# Altium schematic sheet [05] - PERIFERALS DIAGRAM.SchDoc
size A3; DocumentNumber: 2; SheetNumber: 2; SheetTotal: 4; .Checked PCB: .; .Checked SCH: .
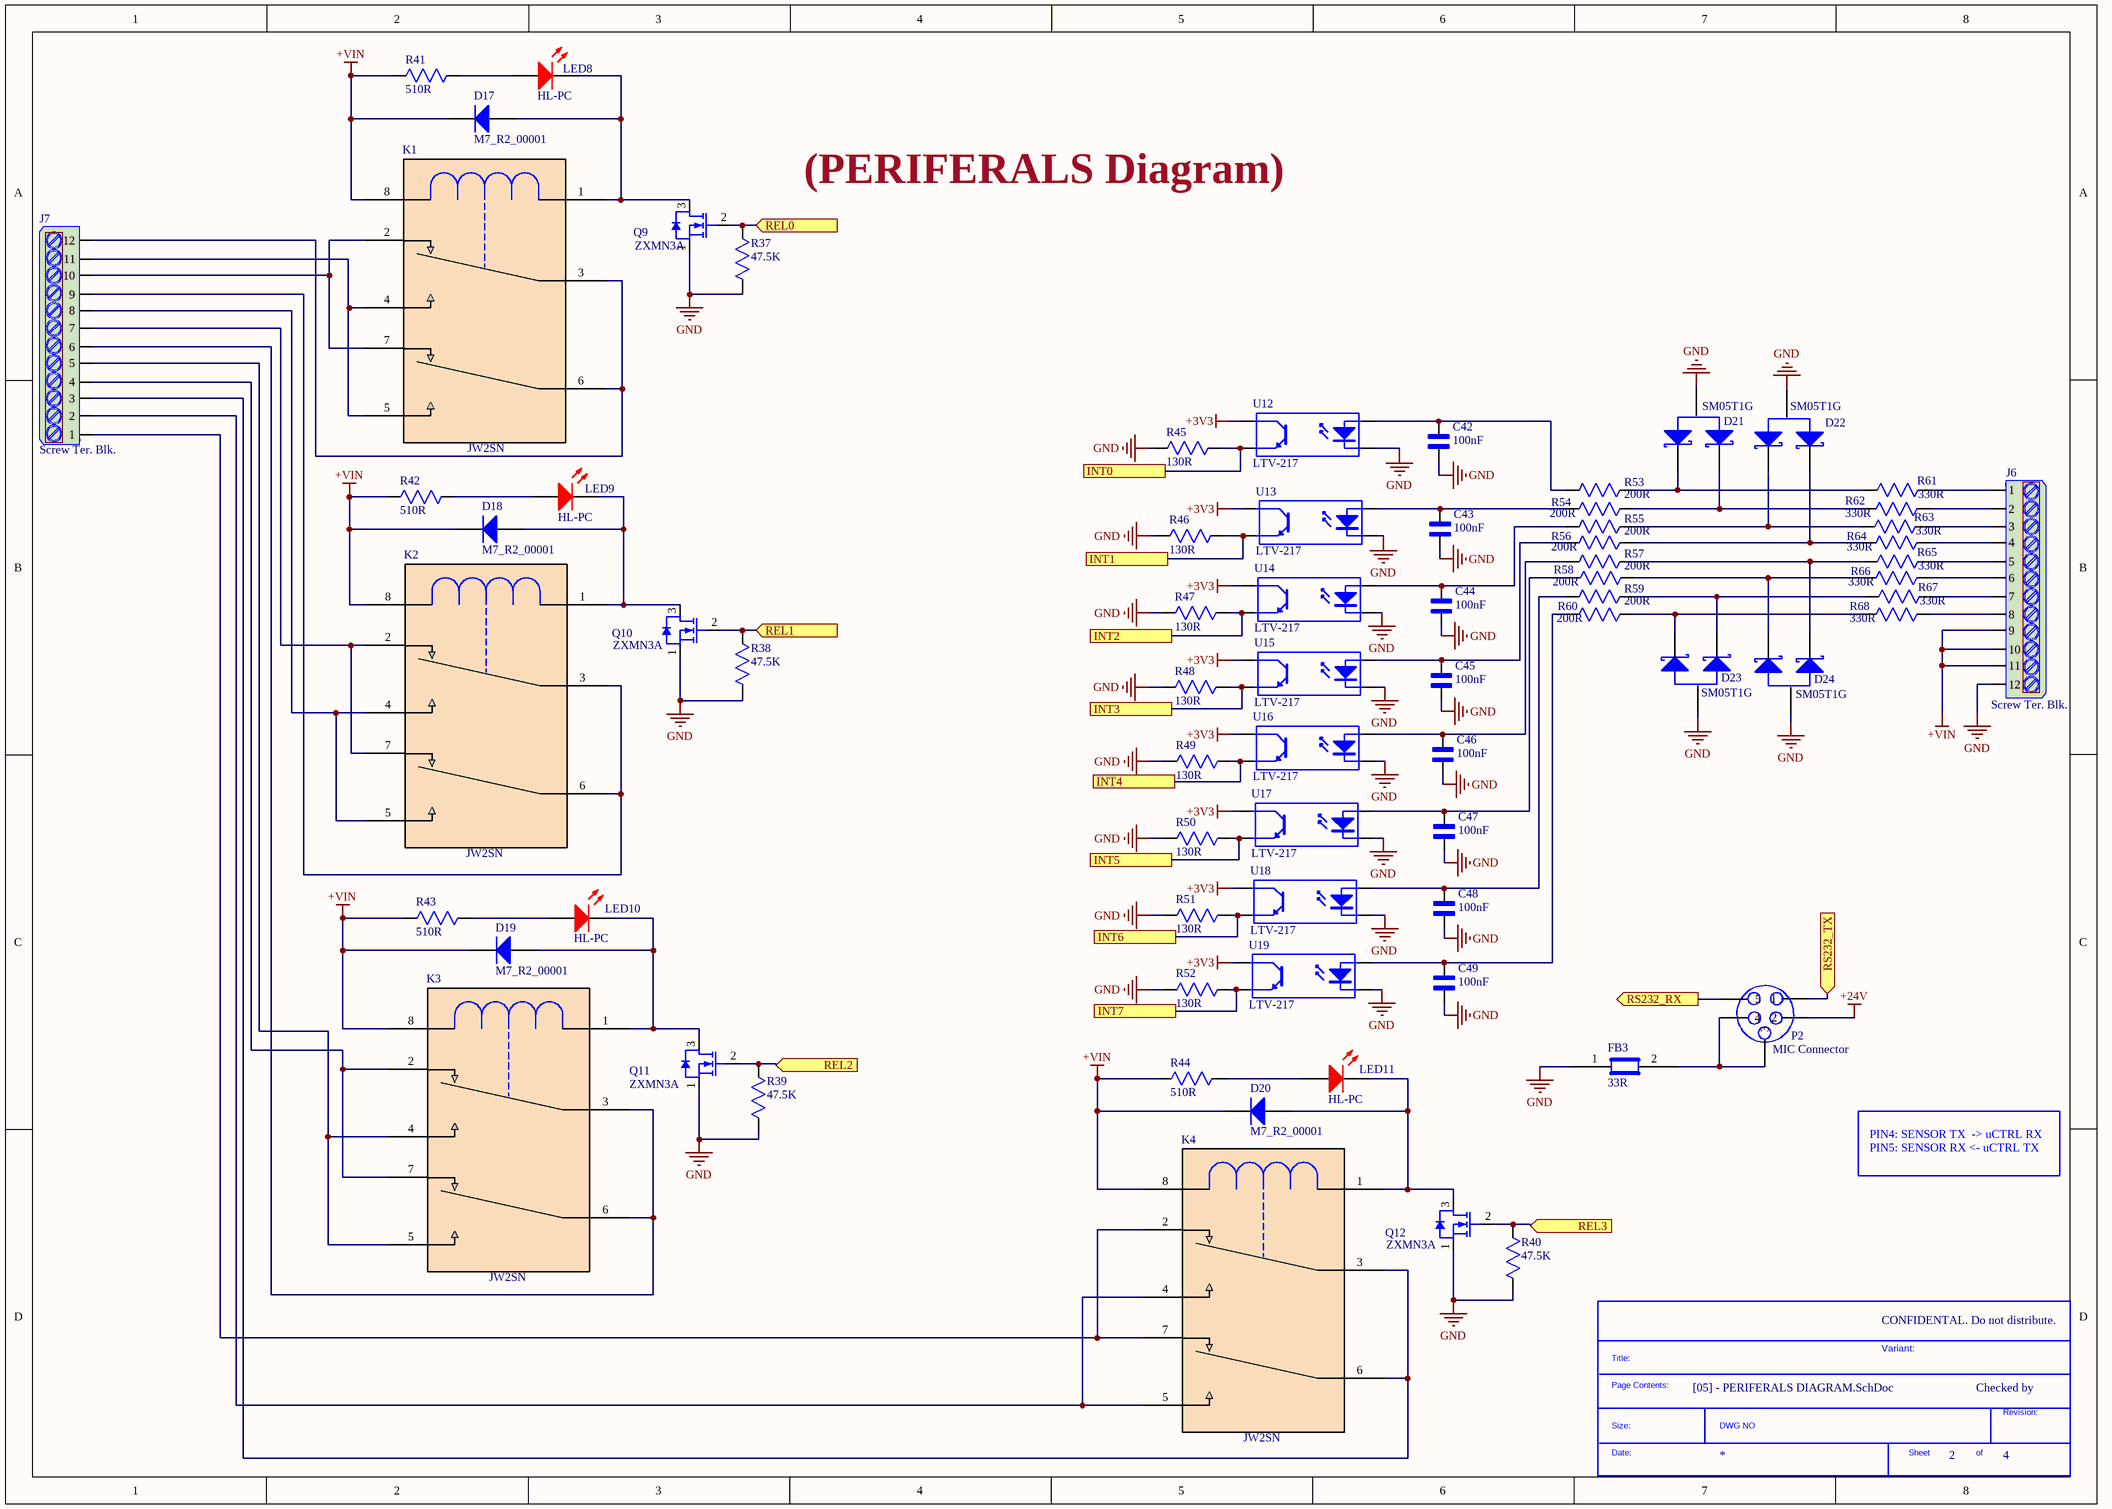
[diagram p0: [05] - PERIFERALS DIAGRAM.SchDoc]

## Parts
*  SDTitleBlock  (value not drawn)  (graphical)
C42  100nF  [CAP_0805]
C43  100nF  [CAP_0805]
C44  100nF  [CAP_0805]
C45  100nF  [CAP_0805]
C46  100nF  [CAP_0805]
C47  100nF  [CAP_0805]
C48  100nF  [CAP_0805]
C49  100nF  [CAP_0805]
D17  M7_R2_00001  [DID_SMA]
D18  M7_R2_00001  [DID_SMA]
D19  M7_R2_00001  [DID_SMA]
D20  M7_R2_00001  [DID_SMA]
D21  SM05T1G  [SOT-23]
D22  SM05T1G  [SOT-23]
D23  SM05T1G  [SOT-23]
D24  SM05T1G  [SOT-23]
FB3  33R  [FB_0603]
J6  Screw Ter. Blk.  [TERM_BLK_12P]
J7  Screw Ter. Blk.  [TERM_BLK_12P]
K1  JW2SN  [RELAY_DPDT]
K2  JW2SN  [RELAY_DPDT]
K3  JW2SN  [RELAY_DPDT]
K4  JW2SN  [RELAY_DPDT]
LED8  HL-PC  [LED_RED_1206]
LED9  HL-PC  [LED_RED_1206]
LED10  HL-PC  [LED_RED_1206]
LED11  HL-PC  [LED_RED_1206]
P2  MIC Connector  [CONN_MIC_5P]
Q9  ZXMN3A  [SOT-23]
Q10  ZXMN3A  [SOT-23]
Q11  ZXMN3A  [SOT-23]
Q12  ZXMN3A  [SOT-23]
R37  47.5K  [RES_0805]
R38  47.5K  [RES_0805]
R39  47.5K  [RES_0805]
R40  47.5K  [RES_0805]
R41  510R  [RES_1206]
R42  510R  [RES_1206]
R43  510R  [RES_1206]
R44  510R  [RES_1206]
R45  130R  [RES_0805]
R46  130R  [RES_0805]
R47  130R  [RES_0805]
R48  130R  [RES_0805]
R49  130R  [RES_0805]
R50  130R  [RES_0805]
R51  130R  [RES_0805]
R52  130R  [RES_0805]
R53  200R  [RES_1206]
R54  200R  [RES_1206]
R55  200R  [RES_1206]
R56  200R  [RES_1206]
R57  200R  [RES_1206]
R58  200R  [RES_1206]
R59  200R  [RES_1206]
R60  200R  [RES_1206]
R61  330R  [RES_1206]
R62  330R  [RES_1206]
R63  330R  [RES_1206]
R64  330R  [RES_1206]
R65  330R  [RES_1206]
R66  330R  [RES_1206]
R67  330R  [RES_1206]
R68  330R  [RES_1206]
U12  LTV-217  [SSOP-4]
U13  LTV-217  [SSOP-4]
U14  LTV-217  [SSOP-4]
U15  LTV-217  [SSOP-4]
U16  LTV-217  [SSOP-4]
U17  LTV-217  [SSOP-4]
U18  LTV-217  [SSOP-4]
U19  LTV-217  [SSOP-4]

## Ports
INT0, INT1, INT2, INT3, INT4, INT5, INT6, INT7, REL0 (in), REL1 (in), REL2 (in), REL3 (in), RS232_RX (out), RS232_TX (in)

## Nets
+3V3: U12.4(C) U13.4(C) U14.4(C) U15.4(C) U16.4(C) U17.4(C) U18.4(C) U19.4(C)
+24V: P2.2
+VIN: D17.2(K) D18.2(K) D19.2(K) D20.2(K) J6.9 J6.10 J6.11 K1.8 K2.8 K3.8 K4.8 R41.2 R42.2 R43.2 R44.2
GND: C42.2 C43.2 C44.2 C45.2 C46.2 C47.2 C48.2 C49.2 D21.3 D22.3 D23.3 D24.3 FB3.1 J6.12 Q9.1(S) Q10.1(S) Q11.1(S) Q12.1(S) R37.2 R38.2 R39.2 R40.2 R45.2 R46.2 R47.2 R48.1 R49.1 R50.2 R51.2 R52.2 U12.2(K) U13.2(K) U14.2(K) U15.2(K) U16.2(K) U17.2(K) U18.2(K) U19.2(K)
INT0: R45.1 U12.3(E) ; port INT0
INT1: R46.1 U13.3(E) ; port INT1
INT2: R47.1 U14.3(E) ; port INT2
INT3: R48.2 U15.3(E) ; port INT3
INT4: R49.2 U16.3(E) ; port INT4
INT5: R50.1 U17.3(E) ; port INT5
INT6: R51.1 U18.3(E) ; port INT6
INT7: R52.1 U19.3(E) ; port INT7
REL0: Q9.2(G) R37.1 ; port REL0
REL1: Q10.2(G) R38.1 ; port REL1
REL2: Q11.2(G) R39.1 ; port REL2
REL3: Q12.2(G) R40.1 ; port REL3
RS232_RX: P2.5 ; port RS232_RX
RS232_TX: P2.1 ; port RS232_TX
NetC42_1: C42.1 R53.2 U12.1(A)
NetC43_1: C43.1 R54.2 U13.1(A)
NetC44_1: C44.1 R55.2 U14.1(A)
NetC45_1: C45.1 R56.2 U15.1(A)
NetC46_1: C46.1 R57.2 U16.1(A)
NetC47_1: C47.1 R58.2 U17.1(A)
NetC48_1: C48.1 R59.2 U18.1(A)
NetC49_1: C49.1 R60.2 U19.1(A)
NetD17_1: D17.1(A) K1.1 LED8.1(K) Q9.3(D)
NetD18_1: D18.1(A) K2.1 LED9.1(K) Q10.3(D)
NetD19_1: D19.1(A) K3.1 LED10.1(K) Q11.3(D)
NetD20_1: D20.1(A) K4.1 LED11.1(K) Q12.3(D)
NetD21_1: D21.1 R53.1 R61.2
NetD21_2: D21.2 R54.1 R62.2
NetD22_1: D22.1 R55.1 R63.2
NetD22_2: D22.2 R56.1 R64.2
NetD23_1: D23.1 R59.1 R67.2
NetD23_2: D23.2 R60.1 R68.2
NetD24_1: D24.1 R57.1 R65.2
NetD24_2: D24.2 R58.1 R66.2
NetFB3_2: FB3.2 P2.3 P2.4
NetJ6_1: J6.1 R61.1
NetJ6_2: J6.2 R62.1
NetJ6_3: J6.3 R63.1
NetJ6_4: J6.4 R64.1
NetJ6_5: J6.5 R65.1
NetJ6_6: J6.6 R66.1
NetJ6_7: J6.7 R67.1
NetJ6_8: J6.8 R68.1
NetJ7_1: J7.1 K4.2 K4.7
NetJ7_2: J7.2 K4.4 K4.5
NetJ7_3: J7.3 K4.3 K4.6
NetJ7_4: J7.4 K3.2 K3.7
NetJ7_5: J7.5 K3.4 K3.5
NetJ7_6: J7.6 K3.3 K3.6
NetJ7_7: J7.7 K2.2 K2.7
NetJ7_8: J7.8 K2.4 K2.5
NetJ7_9: J7.9 K2.3 K2.6
NetJ7_10: J7.10 K1.2 K1.7
NetJ7_11: J7.11 K1.4 K1.5
NetJ7_12: J7.12 K1.3 K1.6
NetLED8_2: LED8.2(A) R41.1
NetLED9_2: LED9.2(A) R42.1
NetLED10_2: LED10.2(A) R43.1
NetLED11_2: LED11.2(A) R44.1

## Notes on the sheet
- (PERIFERALS Diagram)
- PIN4: SENSOR TX  -> uCTRL RX
  PIN5: SENSOR RX <- uCTRL TX
- CONFIDENTAL. Do not distribute.
- Variant:
- Checked by
- (in symbol SDTitleBlock) Title:; Page Contents:; Revision:; Size:; DWG NO; Date:; Sheet; of

## Library data of the parts
C42-C49 = CAP_0805: Product Name: CL21B104JBCNNNC; Product Description: MLCC (2012) 0805 100nF 50VDC ±5% X7R; .Checked PCB: CHK; Package: 0805; Value: 100nF; .Checked SCH: CHK
D17 = DID_SMA: =Product Description; Product Description: DIODE STAND. Single 1A 1000V SMT DO214AC (SMA); .Checked PCB: CHK; Product Name: M7_R2_00001; Package: SMA; Value: M7_R2_00001; .Checked SCH: CHK
D18-D20 = DID_SMA: =Product Description; Product Description: DIODE STAND. Single 1A 1000V SMT DO214AC (SMA); .Checked PCB: .; Product Name: M7_R2_00001; Package: SMA; Value: M7_R2_00001; .Checked SCH: .
D21-D24 = TVS_SOT23: =Product Description; Product Description: DIODE TVS 5VWM 9.8VC SOT23; .Checked PCB: CHK; Product Name: SM05T1G; Value: SM05T1G; Package: SOT23; .Checked SCH: CHK
FB3 = FB_0603: =Product Description; Manufacturer: MURATA; Product Name: BLM18PG330SN1D; Product Description: FERRITE BEAD 0603 33R 3A MURATA; .Checked PCB: CHK; Value: 33R; Package / Case: 0603; .Checked SCH: CHK
J6 J7 = TERM_BLK_12POS: =Product Description; Product Name: GT301-5.0-12P-12-00AH; Product Description: TERM.BLK.5.00MM 12P PCB TYPE; .Checked PCB: CHK; ComponentLink1URL: https://www.molex.com/pdm_docs/sd/395321002_sd.pdf; ComponentLink1Description: https://www.molex.com/pdm_docs/sd/395321002_sd.pdf; Value: Screw Ter. Blk.; .Checked SCH: CHK
K1-K4 = REL_DPDT_12V: =Product Description; Product Name: JW2SN-DC12V; Product Description: RELAY POWER 5A 12VDC 2P PANASONIC; Contact Form: DPDT; .Checked PCB: CHK; Value: JW2SN; .Checked SCH: CHK
LED8 = LED_RED_1206: =Product Description; Manufacturer: HONGLITRONIC; Product Description: LED SMD 1206 RED WATER CLEAR 90-120 mcd 140C; Product Name: HL-PC-3216S9AC; Color: RED; .Checked PCB: CHK; Value: HL-PC; .Checked SCH: CHK
LED9-LED11 = LED_RED_1206: =Product Description; Manufacturer: HONGLITRONIC; Product Description: LED SMD 1206 RED WATER CLEAR 90-120 mcd 140C; Product Name: HL-PC-3216S9AC; Color: RED; .Checked PCB: .; Value: HL-PC; .Checked SCH: .
P2 = CONN_MIC_5P: =Product Description; ComponentLink1URL: https://www.molex.com/pdm_docs/sd/395321002_sd.pdf; ComponentLink1Description: https://www.molex.com/pdm_docs/sd/395321002_sd.pdf; Product Name: *; Product Description: *; Value: MIC Connector
Q9 Q10 = MOSFET_N_SOT23: =Product Description; Manufacturer: DIODES; Product Name: ZXMN3A01FTA; Product Description: MOSFET DIS.1.8A 30V N-CH SOT23 ENHANCEMENT SMT; .Checked PCB: .; Package / Case: SOT23; Value: ZXMN3A; .Checked SCH: .
Q11 Q12 = MOSFET_N_SOT23: =Product Description; Manufacturer: DIODES; Product Name: ZXMN3A01FTA; Product Description: MOSFET DIS.1.8A 30V N-CH SOT23 ENHANCEMENT SMT; .Checked PCB: CHK; Package / Case: SOT23; Value: ZXMN3A; .Checked SCH: CHK
R37 R38 = RES_0805: =Product Description; Product Name: 0805S8F4752T5E; Package2: 0805; Product Description: RES.(2012) 0805 47.5K Ohms 1% 1/8W-S 100PPM; .Checked PCB: .; Value: 47.5K; .Checked SCH: .
R39 R40 = RES_0805: =Product Description; Product Name: 0805S8F4752T5E; Package2: 0805; Product Description: RES.(2012) 0805 47.5K Ohms 1% 1/8W-S 100PPM; .Checked PCB: CHK; Value: 47.5K; .Checked SCH: CHK
R41 = RES_1206: =Product Description; Product Name: 1206S4J0511T5E; Product Description: RES.(3216) 1206 510 Ohms 5% 1/4W-S 100PPM; .Checked PCB: CHK; Package: 1206; Value: 510R; .Checked SCH: CHK
R42-R44 = RES_1206: =Product Description; Product Name: 1206S4J0511T5E; Product Description: RES.(3216) 1206 510 Ohms 5% 1/4W-S 100PPM; .Checked PCB: .; Package: 1206; Value: 510R; .Checked SCH: .
R45-R52 = RES_0805: =Product Description; Product Name: 0805S8J0131T5E; Product Description: RES.(2012) 0805 130 Ohms 5% 1/8W-S 100PPM; .Checked PCB: CHK; Package: 0805; Value: 130R; .Checked SCH: CHK
R53-R60 = RES_1206: =Product Description; Product Name: CQ06W4F2000T5E; Product Description: RES.(3216) 1206 200 Ohms 1% 1/4W-S AUTOMOTIV; .Checked PCB: CHK; Package: 1206; Value: 200R; .Checked SCH: CHK
R61-R68 = RES_1206: =Product Description; Product Name: CQ06W4F3300T5E; Product Description: RES.(3216) 1206 330 Ohms 1% 1/4W-S AUTOMOTIV; .Checked PCB: CHK; Package: 1206; Value: 330R; .Checked SCH: CHK
U12-U19 = OPTCOP: =Product Description; Manufacturer: LITEON; Product Name: LTV-217-B-G; Product Description: IC-217 OPTO. 3750V SSOP4; .Checked PCB: CHK; Package: SSOP4; Value: LTV-217; .Checked SCH: CHK